# Altium schematic sheet 23_Solar_TIA.SchDoc
size A4; SheetNumber: 5; SheetTotal: 16
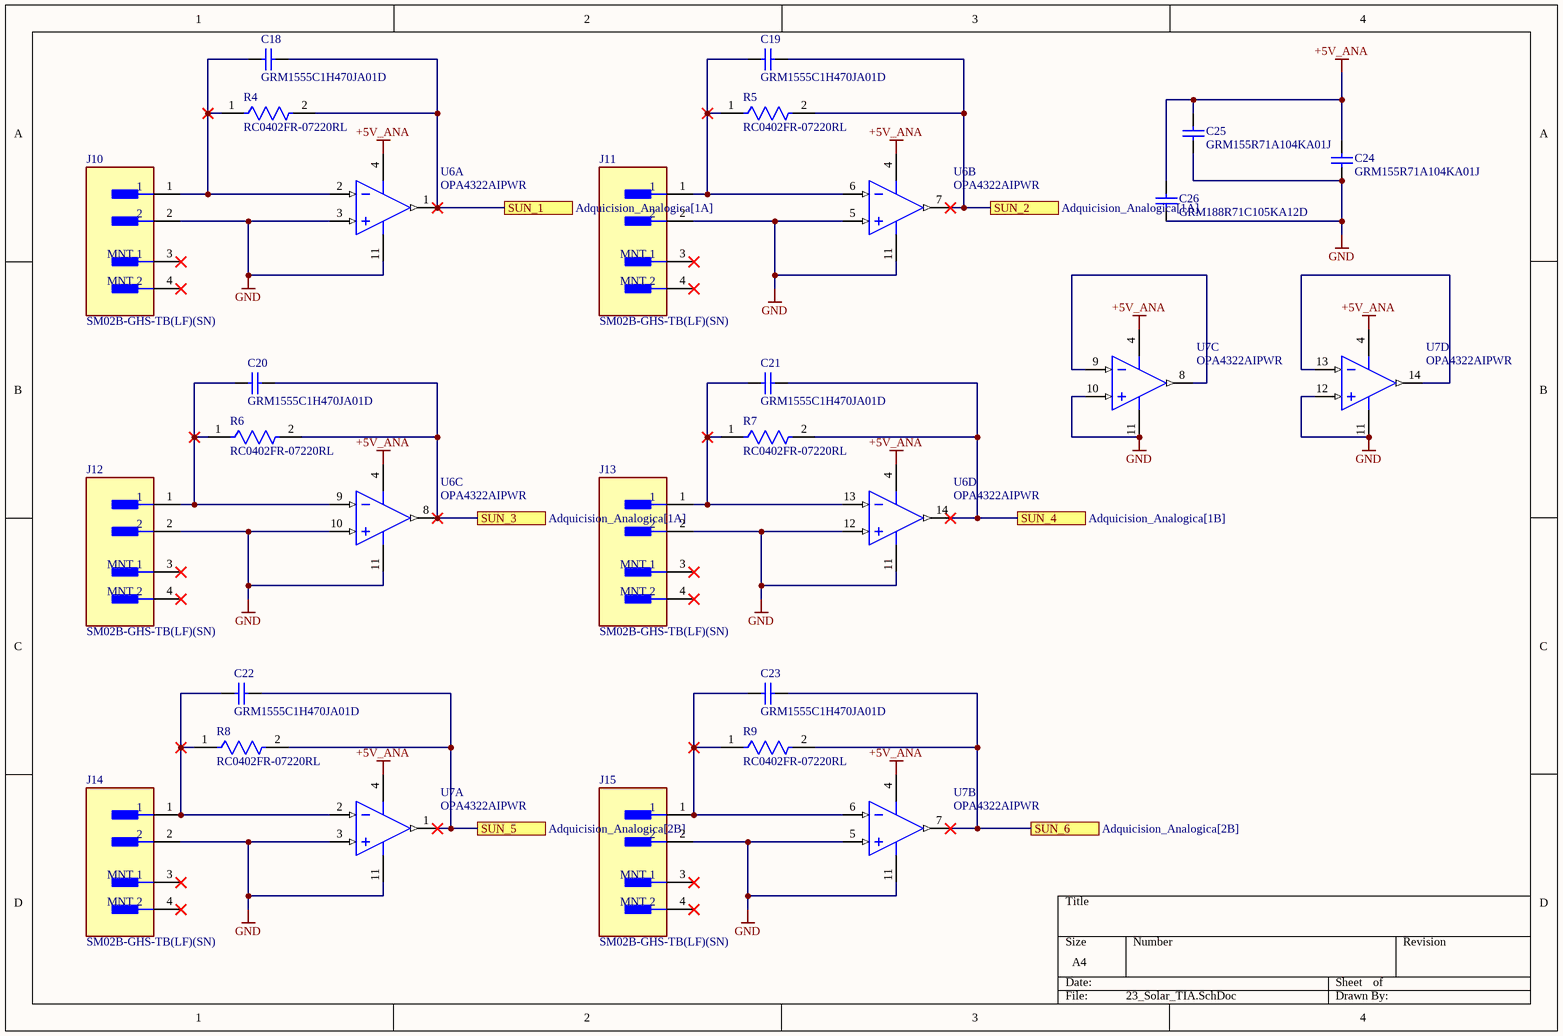
[diagram p0: 23_Solar_TIA.SchDoc]

## Parts
C18  GRM1555C1H470JA01D  [CAPC1005X55X25LL05T10]
C19  GRM1555C1H470JA01D  [CAPC1005X55X25LL05T10]
C20  GRM1555C1H470JA01D  [CAPC1005X55X25LL05T10]
C21  GRM1555C1H470JA01D  [CAPC1005X55X25LL05T10]
C22  GRM1555C1H470JA01D  [CAPC1005X55X25LL05T10]
C23  GRM1555C1H470JA01D  [CAPC1005X55X25LL05T10]
C24  GRM155R71A104KA01J  [CAPC1005X55X25ML05T10]
C25  GRM155R71A104KA01J  [CAPC1005X55X25ML05T10]
C26  GRM188R71C105KA12D  [CAPC1608X90X35ML10T15]
J10  SM02B-GHS-TB(LF)(SN)  [FP-SM02B-GHS-TB_LF_SN-MFG]
J11  SM02B-GHS-TB(LF)(SN)  [FP-SM02B-GHS-TB_LF_SN-MFG]
J12  SM02B-GHS-TB(LF)(SN)  [FP-SM02B-GHS-TB_LF_SN-MFG]
J13  SM02B-GHS-TB(LF)(SN)  [FP-SM02B-GHS-TB_LF_SN-MFG]
J14  SM02B-GHS-TB(LF)(SN)  [FP-SM02B-GHS-TB_LF_SN-MFG]
J15  SM02B-GHS-TB(LF)(SN)  [FP-SM02B-GHS-TB_LF_SN-MFG]
R4  RC0402FR-07220RL  [FP-RC0402-0_4-MFG]
R5  RC0402FR-07220RL  [FP-RC0402-0_4-MFG]
R6  RC0402FR-07220RL  [FP-RC0402-0_4-MFG]
R7  RC0402FR-07220RL  [FP-RC0402-0_4-MFG]
R8  RC0402FR-07220RL  [FP-RC0402-0_4-MFG]
R9  RC0402FR-07220RL  [FP-RC0402-0_4-MFG]
U6  OPA4322AIPWR  [PW0014A_N]  (parts A,B,C,D of 4)
U7  OPA4322AIPWR  [PW0014A_N]  (parts A,B,C,D of 4)

## Ports
SUN_1 (see Adquicision_Analogica[1A]), SUN_2 (see Adquicision_Analogica[1A]), SUN_3 (see Adquicision_Analogica[1A]), SUN_4 (see Adquicision_Analogica[1B]), SUN_5 (see Adquicision_Analogica[2B]), SUN_6 (see Adquicision_Analogica[2B])

## Nets
+5V_ANA: C24.2 C25.2 C26.2 U6.4(V+) U7.4(V+)
GND: C24.1 C25.1 C26.1 J10.2 J11.2 J12.2 J13.2 J14.2 J15.2 U6.3(IN_A+) U6.5(IN_B+) U6.10(IN_C+) U6.11(V-) U6.12(IN_D+) U7.3(IN_A+) U7.5(IN_B+) U7.10(IN_C+) U7.11(V-) U7.12(IN_D+)
SUN_1: C18.2 R4.2 U6.1(OUT_A) ; port SUN_1
SUN_2: C19.2 R5.2 U6.7(OUT_B) ; port SUN_2
SUN_3: C20.2 R6.2 U6.8(OUT_C) ; port SUN_3
SUN_4: C21.2 R7.2 U6.14(OUT_D) ; port SUN_4
SUN_5: C22.2 R8.2 U7.1(OUT_A) ; port SUN_5
SUN_6: C23.2 R9.2 U7.7(OUT_B) ; port SUN_6
NetC18_1: C18.1 J10.1 R4.1 U6.2(IN_A-)
NetC19_1: C19.1 J11.1 R5.1 U6.6(IN_B-)
NetC20_1: C20.1 J12.1 R6.1 U6.9(IN_C-)
NetC21_1: C21.1 J13.1 R7.1 U6.13(IN_D-)
NetC22_1: C22.1 J14.1 R8.1 U7.2(IN_A-)
NetC23_1: C23.1 J15.1 R9.1 U7.6(IN_B-)
NetU7_8: U7.8(OUT_C) U7.9(IN_C-)
NetU7_13: U7.13(IN_D-) U7.14(OUT_D)

Not connected (* = marked no-connect by the designer): J10 3(MNT_1)* 4(MNT_2)*; J11 3(MNT_1)* 4(MNT_2)*; J12 3(MNT_1)* 4(MNT_2)*; J13 3(MNT_1)* 4(MNT_2)*; J14 3(MNT_1)* 4(MNT_2)*; J15 3(MNT_1)* 4(MNT_2)*

## Library data of the parts
C18-C23 = CMP-2008-04368-1: Manufacturer: Murata; Part Number: GRM1555C1H470JA01D
C24 C25 = CMP-2008-04031-1: Manufacturer: Murata; Part Number: GRM155R71A104KA01J
C26 = CMP-2006-02845-1: Manufacturer: Murata; Part Number: GRM188R71C105KA12D
J10-J15 = CMP-2000-07076-2: CONN HEADER SMD R/A 2POS 1.25MM; Voltage Rating: 50V; Number of Positions: 2; Pitch: 0.049inch; Current Rating: 1A; Connector Type: Outer Shroud Contact; Number of Rows: 1; Contact Material: Bronze; Termination: Solder; Color: Natural; Package Quantity: 2500; Mount: Surface Mount; Housing Color: Natural; Number of Contacts: 2; Packaging: Tape and Reel; Lead Free: Lead Free; Housing Material: Nylon; Orientation: Right Angle; Contact Type: Male Pin; Contact Plating: Tin; Series: GH; Fastening Type: Latch
R4-R9 = CMP-2002-07511-2: NexarPartId: 39818460; Tolerance: 1%; Voltage Rating (AC): 50V; Max Power Dissipation: 63mW; Temperature Coefficient: 100ppm/°C; Power Rating: 62.5mW; Resistance: 220Ω; Voltage Rating (DC): 50V; Voltage Rating: 50V; Schedule B: 8533210045, 8533210045; Min Operating Temperature: -55°C; Termination: SMD/SMT; Lead Free: Lead Free; Width: 500µm; Military Standard: Not; Features: Moisture Resistant; Case/Package: 0402; Max Operating Temperature: 155°C; Height: 350µm; Number of Pins: 2; Depth: 500µm; REACH SVHC: No SVHC; Number of Terminations: 2; Composition: Thick Film; Packaging: Tape & Reel; Length: 1mm; Case Code (Imperial): 0402; RoHS: Compliant
U6 U7 = CMP-0272-01739-3: 20 MHz, Low Noise, RRIO, CMOS Operational Amplifier, 1.8 to 5.5 V, -40 to 125 degC, 14-pin SOP (PW14), Green (RoHS & no Sb/Br); Manufacturer: Texas Instruments; Sub Family: High Output Current Amplifier (>=50mA), Low Input Bias Current Amp (<=10pA), Low Noise Amp (<=10nV/rtHz), Low Supply Voltage Amplifier (<=2.7V), Precision Amplifier; Vio (25C)(Max)(mV): 2; IIB(Max)(pA): 10; Total Supply Voltage(Max)(+5V is 5, +/-5V is 10): 5.5; Iq per channel(Max)(mA): 1.65; Total Supply Voltage(Min)(+5V is 5, +/-5V is 10): 1.8; Rating: Catalog; CMRR(Min)(dB): 90; Packing: LARGE T&R; Number of Channels: 4; GBW(Typ)(MHz): 20; ComponentLink2URL: http://www.ti.com/lit/ds/symlink/opa4322.pdf; ComponentLink1URL: http://www.ti.com/; ComponentLink2Description: Datasheet; ComponentLink3URL: http://www.ti.com/litv/pdf/mpds360; PackageReference: PW0014A; Mounting Technology: Surface Mount; PartNumber: OPA4322AIPWR; Eco-Plan: Green (RoHS & no Sb/Br); ComponentLink3Description: Package Specification; ComponentLink1Description: Manufacturer URL; DatasheetVersion: SBOS538E; PackageDescription: 14-Pin Plastic Small Outline, Body 5 x 4.4 mm, Pitch 0.65 mm; PackageVersion: 4040064-3/G, 02/2011; Offset Drift(Typ)(uV/C): 1.8; Slew Rate(Typ)(V/us): 10; Code_JEDEC: MO-153